# Altium schematic sheet EMMC.SchDoc
size A4; SheetNumber: 7; SheetTotal: 10
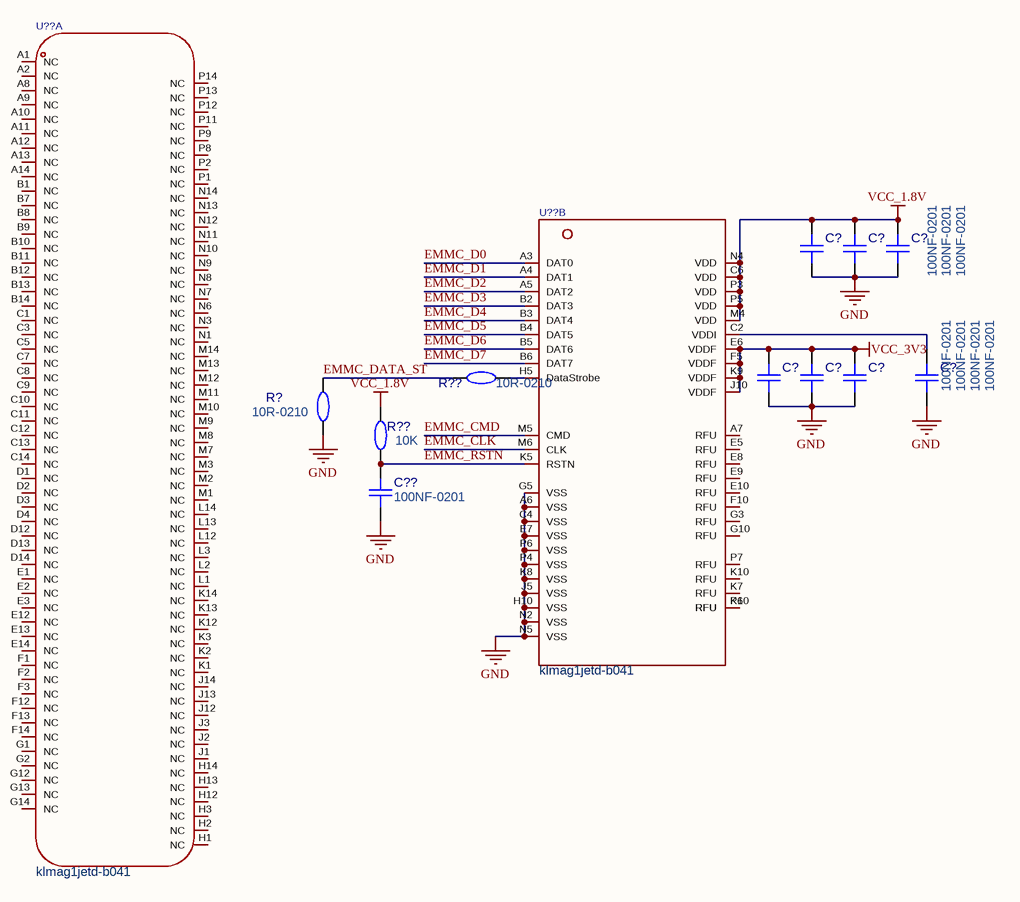
[diagram p0: EMMC.SchDoc]

## Parts
(Parts that share a designator on the sheet are numbered #1, #2 ... from top to bottom, then left to right.)
C?#1  100NF-0201  [C0201]
C?#2  100NF-0201  [C0201]
C?#3  100NF-0201  [C0201]
C?#4  100NF-0201  [C0201]
C?#5  100NF-0201  [C0201]
C?#6  100NF-0201  [C0201]
C?#7  100NF-0201  [C0201]
C??  100NF-0201  [C0201]
R?  10R-0210  [R0201]
R??#1  10R-0210  [R0201]
R??#2  10K  [R0201]
U??#1  klmag1jetd-b041  [FBGA-153_L13.0-W11.5-P0.50_KLMAG1JETD-B041]  (part B of 2)
U??#2  klmag1jetd-b041  [FBGA-153_L13.0-W11.5-P0.50_KLMAG1JETD-B041]  (part A of 2)

## Nets
GND: C?#1.1 C?#2.1 C?#3.1 C?#4.1 C?#5.1 C?#6.1 C?#7.1 C??.1 R?.2 U??#1.A6(VSS) U??#1.C4(VSS) U??#1.E7(VSS) U??#1.G5(VSS) U??#1.H10(VSS) U??#1.J5(VSS) U??#1.K8(VSS) U??#1.N2(VSS) U??#1.N5(VSS) U??#1.P4(VSS) U??#1.P6(VSS)
VCC_1.8V: C?#1.2 C?#2.2 C?#3.2 R??#2.2 U??#1.C6(VDD) U??#1.M4(VDD) U??#1.N4(VDD) U??#1.P3(VDD) U??#1.P5(VDD)
VCC_3V3: C?#4.2 C?#5.2 C?#6.2 U??#1.E6(VDDF) U??#1.F5(VDDF) U??#1.J10(VDDF) U??#1.K9(VDDF)
EMMC_CLK: U??#1.M6(CLK)
EMMC_CMD: U??#1.M5(CMD)
EMMC_D0: U??#1.A3(DAT0)
EMMC_D1: U??#1.A4(DAT1)
EMMC_D2: U??#1.A5(DAT2)
EMMC_D3: U??#1.B2(DAT3)
EMMC_D4: U??#1.B3(DAT4)
EMMC_D5: U??#1.B4(DAT5)
EMMC_D6: U??#1.B5(DAT6)
EMMC_D7: U??#1.B6(DAT7)
EMMC_DATA_ST: R?.1 R??#1.1
EMMC_RSTN: C??.2 R??#2.1 U??#1.K5(RSTN)
NetC?#7_2: C?#7.2 U??#1.C2(VDDI)
NetR??#1_2: R??#1.2 U??#1.H5(DataStrobe)
NetU??#1_K6: U??#1.K6(RFU) U??#1.P10(RFU)

Not connected (* = marked no-connect by the designer): U??#1 A7(RFU) E5(RFU) E8(RFU) E9(RFU) E10(RFU) F10(RFU) G3(RFU) G10(RFU) K7(RFU) K10(RFU) P7(RFU); U??#2 A1(NC) A2(NC) A8(NC) A9(NC) A10(NC) A11(NC) A12(NC) A13(NC) A14(NC) B1(NC) B7(NC) B8(NC) B9(NC) B10(NC) B11(NC) B12(NC) B13(NC) B14(NC) C1(NC) C3(NC) C5(NC) C7(NC) C8(NC) C9(NC) C10(NC) C11(NC) C12(NC) C13(NC) C14(NC) D1(NC) D2(NC) D3(NC) D4(NC) D12(NC) D13(NC) D14(NC) E1(NC) E2(NC) E3(NC) E12(NC) E13(NC) E14(NC) F1(NC) F2(NC) F3(NC) F12(NC) F13(NC) F14(NC) G1(NC) G2(NC) G12(NC) G13(NC) G14(NC) H1(NC) H2(NC) H3(NC) H12(NC) H13(NC) H14(NC) J1(NC) J2(NC) J3(NC) J12(NC) J13(NC) J14(NC) K1(NC) K2(NC) K3(NC) K12(NC) K13(NC) K14(NC) L1(NC) L2(NC) L3(NC) L12(NC) L13(NC) L14(NC) M1(NC) M2(NC) M3(NC) M7(NC) M8(NC) M9(NC) M10(NC) M11(NC) M12(NC) M13(NC) M14(NC) N1(NC) N3(NC) N6(NC) N7(NC) N8(NC) N9(NC) N10(NC) N11(NC) N12(NC) N13(NC) N14(NC) P1(NC) P2(NC) P8(NC) P9(NC) P11(NC) P12(NC) P13(NC) P14(NC)

## Library data of the parts
C?#1-C?#7 C?? = 0201-C: 容值:1uF;精度:±20%;额定电压:6.3V;温度系数:X5R;; Manufacturer: muRata(村田); Symbol: GRM033R60J105MEA2D; AddInBom: yes; ModelId: e8033a7cb35143ffb28e3b81b2577ea0; ModelName: C0201_L0.6-W0.3-H0.3; ModelTransform: 23.622,11.811,0,0,0,0,0,0,0; Value: 1uF; Tolerance: ±20%; Voltage Rating: 6.3V; Temperature Coefficient: X5R; LCSC Part Name: 1uF ±20% 6.3V; SupplierPart: C76930; ManufacturerPart: GRM033R60J105MEA2D; Supplier Footprint: 0201; JLCPCB Part Class: Extended Part; Datasheet: https://item.szlcsc.com/datasheet/GRM033R60J105MEA2D/78057.html; Supplier: LCSC; ConvertToPcb: yes; FootprintName: C0201
R? R??#1 R??#2 = 0210-R: 电阻类型:厚膜电阻;阻值:10kΩ;精度:±1%;功率:50mW;工作电压:25V;温度系数:±200ppm/℃;; Manufacturer: YAGEO(国巨); Symbol: RC0201FR-0710KL; AddInBom: yes; ModelId: 0e006ba4c37b4b73b0e85d5d1c6800cb; ModelName: R0201_L0.6-W0.3-H0.3; ModelTransform: 23.622,11.811,0,0,0,0,0,-0.0005,0; Value: 10kΩ; Tolerance: ±1%; Power(Watts): 50mW; Voltage-Supply(Max): 25V; LCSC Part Name: 厚膜电阻 10kΩ ±1% 50mW; SupplierPart: C106225; ManufacturerPart: RC0201FR-0710KL; Supplier Footprint: 0201; JLCPCB Part Class: Extended Part; Datasheet: https://item.szlcsc.com/datasheet/RC0201FR-0710KL/107440.html; Supplier: LCSC; ConvertToPcb: yes; FootprintName: R0201; Type: 厚膜电阻; Temperature Coefficient: ±200ppm/℃; Operating Temperature: -55℃~+125℃
U??#1 U??#2 = klmag1jetd-b041: NAND闪存类型:-;协议版本:eMMC 5.1;存储容量:16GB;; Manufacturer: SAMSUNG(三星半导体); AddInBom: yes; ModelId: e295469cf8df408b9f13391ad06a16e8; ModelName: FBGA-153_L13.0-W11.5-H1.1-P0.50_KLMAG1JETD-B041; ModelTransform: 452.755,511.81,0,0,0,0,0,0,0; Memory Size: 16GB; Reading Speed in Sequence: 330MB/S; Writing Speed in Sequence: 50MB/S; NAND Operating Voltage (VCCF): 2.7V~3.6V; Controller Operating Voltage (VCCQ): 2.7V~3.6V；1.7V~1.95V; Symbol: KLMAG1JETD-B041; LCSC Part Name: 嵌入式多媒体卡，兼容eMMC 5.1规范，支持HS400模式; SupplierPart: C499919; ManufacturerPart: KLMAG1JETD-B041; Supplier Footprint: FBGA-153; JLCPCB Part Class: Extended Part; Datasheet: https://item.szlcsc.com/datasheet/KLMAG1JETD-B041/512099.html; Supplier: LCSC; ConvertToPcb: yes; FootprintName: FBGA-153_L13.0-W11.5-P0.50_KLMAG1JETD-B041; NAND Flash Type: -; Protocol Version: eMMC 5.1; Operating Temperature: -25℃~+85℃; NAND Stand-By Current: -; Controller Stand-By Current: -; Features: 硬件复位功能；ECC纠错功能；内置磨损均衡功能；坏块管理功能；安全写保护功能